# Altium project FMM-v1.0.PrjPcb (part 1 of 6)
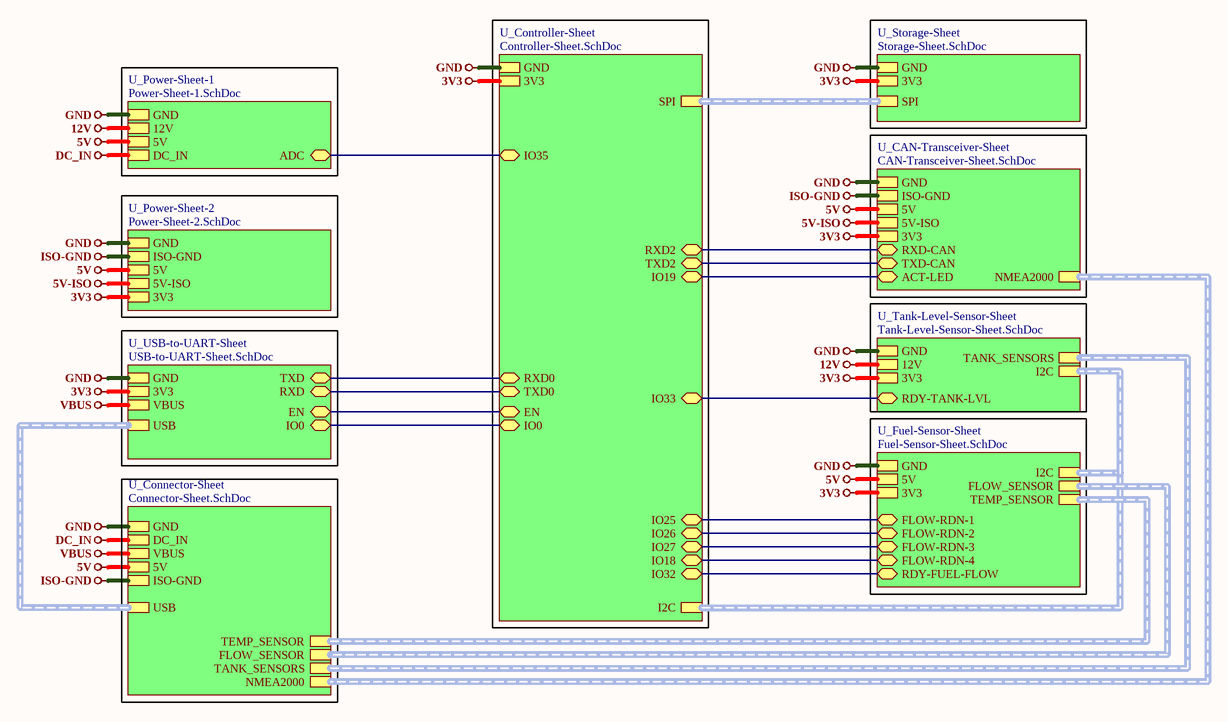
[diagram p0: Top-Sheet.SchDoc]
10 sheets, 218 parts. Net scope: hierarchical (ports join the sheet entries above them; power ports are global).
Board file: FMM-v1.0.PcbDoc
Sheets:
  Top-Sheet.SchDoc
    U_Power-Sheet-1 = Power-Sheet-1.SchDoc
    U_Power-Sheet-2 = Power-Sheet-2.SchDoc
    U_USB-to-UART-Sheet = USB-to-UART-Sheet.SchDoc
    U_Controller-Sheet = Controller-Sheet.SchDoc
    U_Storage-Sheet = Storage-Sheet.SchDoc
    U_CAN-Transceiver-Sheet = CAN-Transceiver-Sheet.SchDoc
    U_Tank-Level-Sensor-Sheet = Tank-Level-Sensor-Sheet.SchDoc
    U_Fuel-Sensor-Sheet = Fuel-Sensor-Sheet.SchDoc
    U_Connector-Sheet = Connector-Sheet.SchDoc

## Sheet Top-Sheet.SchDoc
size A4; SheetNumber: 1; SheetTotal: 10

### Sub-sheets
U_CAN-Transceiver-Sheet = CAN-Transceiver-Sheet.SchDoc: GND, 3V3, 5V-ISO, ISO-GND, RXD-CAN (bidir), TXD-CAN (bidir), ACT-LED (bidir), 5V, NMEA2000 (harness NMEA2000)
U_Connector-Sheet = Connector-Sheet.SchDoc: GND, DC_IN, VBUS, USB (harness USB), NMEA2000 (harness NMEA2000), ISO-GND, TANK_SENSORS (harness TANK_SENSORS), TEMP_SENSOR (harness TEMP_SENSOR), FLOW_SENSOR (harness FLOW_SENSOR), 5V
U_Controller-Sheet = Controller-Sheet.SchDoc: I2C (harness I2C), GND, 3V3, SPI (harness SPI), TXD0 (bidir), RXD0 (bidir), EN (bidir), IO0 (bidir), TXD2 (bidir), RXD2 (bidir), IO25 (bidir), IO26 (bidir), IO27 (bidir), IO18 (bidir), IO19 (bidir), IO35 (bidir), IO32 (bidir), IO33 (bidir)
U_Fuel-Sensor-Sheet = Fuel-Sensor-Sheet.SchDoc: I2C (harness I2C), 5V, GND, 3V3, FLOW-RDN-1 (bidir), FLOW-RDN-2 (bidir), FLOW-RDN-3 (bidir), FLOW-RDN-4 (bidir), RDY-FUEL-FLOW (bidir), TEMP_SENSOR (harness TEMP_SENSOR), FLOW_SENSOR (harness FLOW_SENSOR)
U_Power-Sheet-1 = Power-Sheet-1.SchDoc: 5V, GND, 12V, ADC (bidir), DC_IN
U_Power-Sheet-2 = Power-Sheet-2.SchDoc: 5V, GND, 3V3, 5V-ISO, ISO-GND
U_Storage-Sheet = Storage-Sheet.SchDoc: SPI (harness SPI), GND, 3V3
U_Tank-Level-Sensor-Sheet = Tank-Level-Sensor-Sheet.SchDoc: GND, 3V3, 12V, I2C (harness I2C), RDY-TANK-LVL (bidir), TANK_SENSORS (harness TANK_SENSORS)
U_USB-to-UART-Sheet = USB-to-UART-Sheet.SchDoc: GND, 3V3, TXD (bidir), RXD (bidir), EN (bidir), IO0 (bidir), VBUS, USB (harness USB)

### Nets
3V3: sheet U_Power-Sheet-2/3V3, sheet U_USB-to-UART-Sheet/3V3, sheet U_Controller-Sheet/3V3, sheet U_Storage-Sheet/3V3, sheet U_CAN-Transceiver-Sheet/3V3, sheet U_Tank-Level-Sensor-Sheet/3V3, sheet U_Fuel-Sensor-Sheet/3V3
5V: sheet U_Power-Sheet-1/5V, sheet U_Power-Sheet-2/5V, sheet U_CAN-Transceiver-Sheet/5V, sheet U_Fuel-Sensor-Sheet/5V, sheet U_Connector-Sheet/5V
5V-ISO: sheet U_Power-Sheet-2/5V-ISO, sheet U_CAN-Transceiver-Sheet/5V-ISO
12V: sheet U_Power-Sheet-1/12V, sheet U_Tank-Level-Sensor-Sheet/12V
DC_IN: sheet U_Power-Sheet-1/DC_IN, sheet U_Connector-Sheet/DC_IN
GND: sheet U_Power-Sheet-1/GND, sheet U_Power-Sheet-2/GND, sheet U_USB-to-UART-Sheet/GND, sheet U_Controller-Sheet/GND, sheet U_Storage-Sheet/GND, sheet U_CAN-Transceiver-Sheet/GND, sheet U_Tank-Level-Sensor-Sheet/GND, sheet U_Fuel-Sensor-Sheet/GND, sheet U_Connector-Sheet/GND
ISO-GND: sheet U_Power-Sheet-2/ISO-GND, sheet U_CAN-Transceiver-Sheet/ISO-GND, sheet U_Connector-Sheet/ISO-GND
VBUS: sheet U_USB-to-UART-Sheet/VBUS, sheet U_Connector-Sheet/VBUS
ACT-LED: sheet U_Controller-Sheet/IO19, sheet U_CAN-Transceiver-Sheet/ACT-LED
ADC: sheet U_Power-Sheet-1/ADC, sheet U_Controller-Sheet/IO35
EN: sheet U_USB-to-UART-Sheet/EN, sheet U_Controller-Sheet/EN
FLOW-RDN-1: sheet U_Controller-Sheet/IO25, sheet U_Fuel-Sensor-Sheet/FLOW-RDN-1
FLOW-RDN-2: sheet U_Controller-Sheet/IO26, sheet U_Fuel-Sensor-Sheet/FLOW-RDN-2
FLOW-RDN-3: sheet U_Controller-Sheet/IO27, sheet U_Fuel-Sensor-Sheet/FLOW-RDN-3
FLOW-RDN-4: sheet U_Controller-Sheet/IO18, sheet U_Fuel-Sensor-Sheet/FLOW-RDN-4
IO0: sheet U_USB-to-UART-Sheet/IO0, sheet U_Controller-Sheet/IO0
IO32: sheet U_Controller-Sheet/IO32, sheet U_Fuel-Sensor-Sheet/RDY-FUEL-FLOW
IO33: sheet U_Controller-Sheet/IO33, sheet U_Tank-Level-Sensor-Sheet/RDY-TANK-LVL
RXD: sheet U_USB-to-UART-Sheet/RXD, sheet U_Controller-Sheet/TXD0
RXD0: sheet U_USB-to-UART-Sheet/TXD, sheet U_Controller-Sheet/RXD0
RXD-CAN: sheet U_Controller-Sheet/RXD2, sheet U_CAN-Transceiver-Sheet/RXD-CAN
TXD-CAN: sheet U_Controller-Sheet/TXD2, sheet U_CAN-Transceiver-Sheet/TXD-CAN

### Buses and harness runs
harness sheet U_CAN-Transceiver-Sheet/NMEA2000 = sheet U_Connector-Sheet/NMEA2000
harness sheet U_Connector-Sheet/FLOW_SENSOR = sheet U_Fuel-Sensor-Sheet/FLOW_SENSOR
harness sheet U_Connector-Sheet/TANK_SENSORS = sheet U_Tank-Level-Sensor-Sheet/TANK_SENSORS
harness sheet U_Connector-Sheet/TEMP_SENSOR = sheet U_Fuel-Sensor-Sheet/TEMP_SENSOR
harness sheet U_Connector-Sheet/USB = sheet U_USB-to-UART-Sheet/USB
harness sheet U_Controller-Sheet/I2C = sheet U_Fuel-Sensor-Sheet/I2C = sheet U_Tank-Level-Sensor-Sheet/I2C
harness sheet U_Controller-Sheet/SPI = sheet U_Storage-Sheet/SPI

### Notes on the sheet
- File:
- Title:
- Date:
- Page
- Num:
- Total:
- Drawn By: Huzaifa Ali

## Sheet Power-Sheet-1.SchDoc
size A4; SheetNumber: 2; SheetTotal: 10
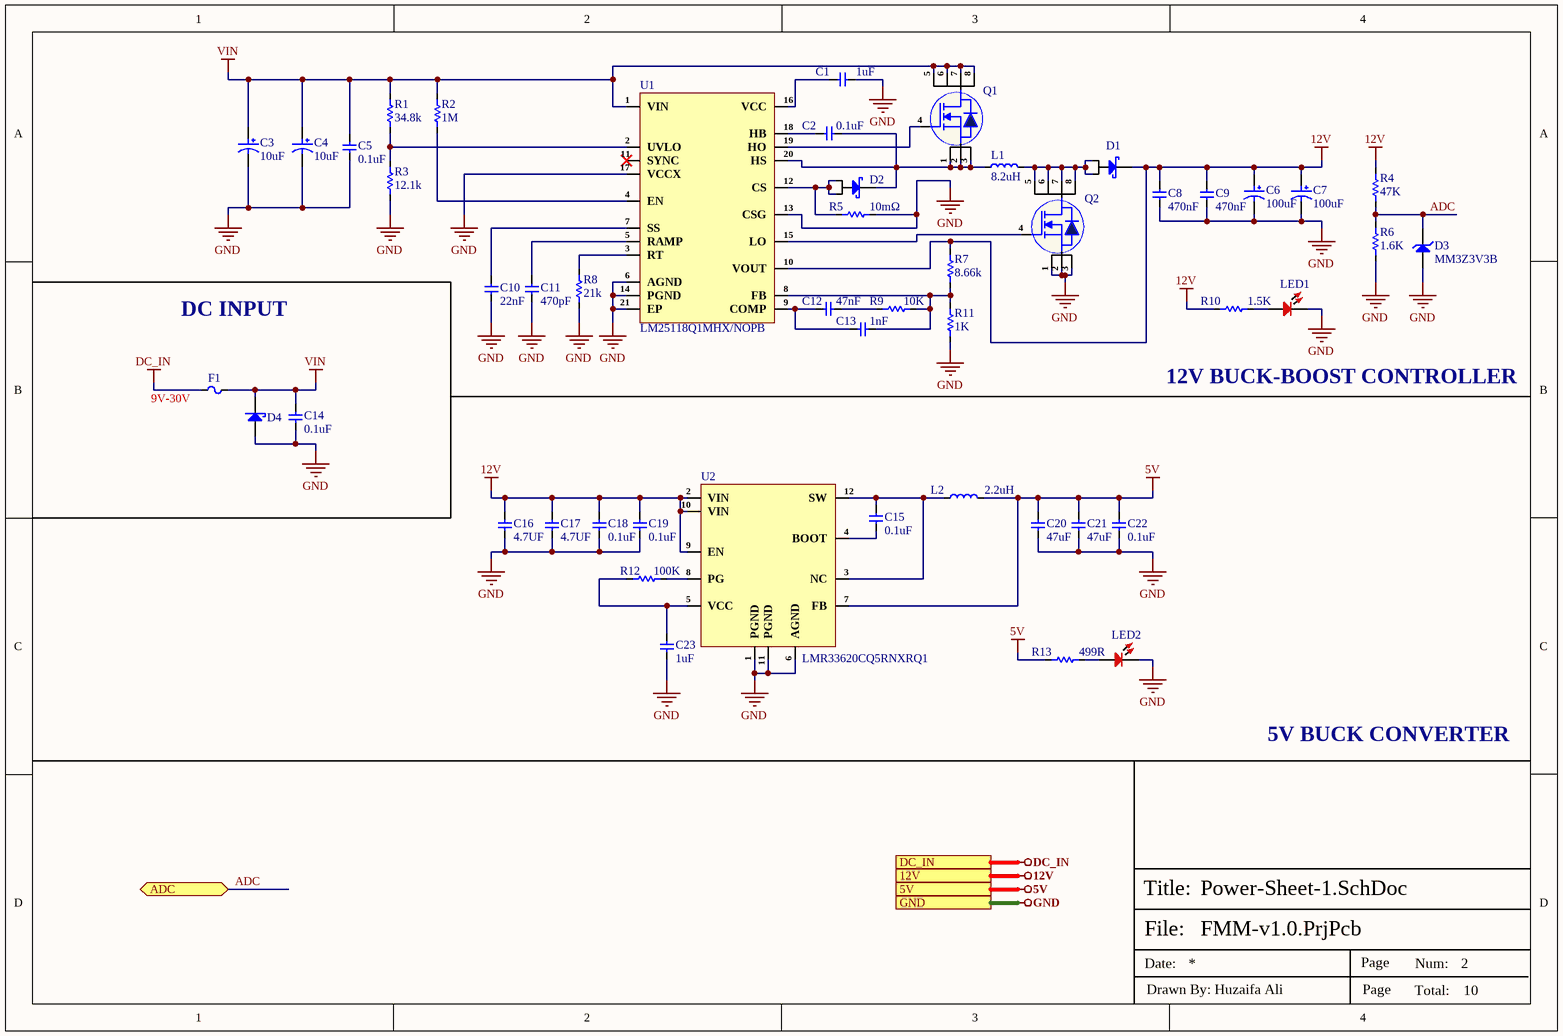
[diagram p1: Power-Sheet-1.SchDoc]

### Parts
C1  1uF  [Cap-0402]
C2  0.1uF  [Cap-0402]
C3  10uF  [50SVPF10M]
C4  10uF  [50SVPF10M]
C5  0.1uF  [Cap-0402]
C6  100uF  [25SVPF100M]
C7  100uF  [25SVPF100M]
C8  470nF  [Cap-0603]
C9  470nF  [Cap-0603]
C10  22nF  [Cap-0402]
C11  470pF  [Cap-0402]
C12  47nF  [Cap-0402]
C13  1nF  [Cap-0402]
C14  0.1uF  [Cap-0402]
C15  0.1uF  [Cap-0402]
C16  4.7UF  [Cap-0603]
C17  4.7UF  [Cap-0603]
C18  0.1uF  [Cap-0402]
C19  0.1uF  [Cap-0402]
C20  47uF  [Cap-1206]
C21  47uF  [Cap-1206]
C22  0.1uF  [Cap-0402]
C23  1uF  [Cap-0402]
D1  STPS20M100SG-TR  [D2Pak.]  (value not drawn)
D2  PDS760-13  [Power-DI-5]  (value not drawn)
D3  MM3Z3V3B  [SOD323F]
D4  3.0SMCJ30AQ-13  [SMC]  (value not drawn)
F1  BSMD1206-100-16V  [Fuse 1206 (3216 Metric)]  (value not drawn)
L1  8.2uH  [SRP1265A-8R2M]
L2  2.2uH  [CLF7045T-2R2N-D]
LED1  RED  [LED-0603]  (value not drawn)
LED2  RED  [LED-0603]  (value not drawn)
Q1  CSD18504Q5A  [8-VSONP (5x6)]  (value not drawn)
Q2  CSD17309Q3  [8-VSON-CLIP (3.3x3.3)]  (value not drawn)
R1  34.8k  [Res-0402]
R2  1M  [Res-0402]
R3  12.1k  [Res-0402]
R4  47K  [Res-0603]
R5  10mΩ  [RES-2512]
R6  1.6K  [Res-0402]
R7  8.66k  [Res-0402]
R8  21k  [Res-0402]
R9  10K  [Res-0402]
R10  1.5K  [Res-0402]
R11  1K  [Res-0402]
R12  100K  [Res-0402]
R13  499R  [Res-0402]
U1  LM25118Q1MHX/NOPB  [20-HTSSOP]
U2  LMR33620CQ5RNXRQ1  [12-VQFN-HR (3x2)]

### Ports
5V (see Top-Sheet[1A], CAN-Transceiver-Sheet[3D], Connector-Sheet[3D], Fuel-Sensor-Sheet[4C], Power-Sheet-2[3D]), 12V (see Top-Sheet[1A], Tank-Level-Sensor-Sheet[3D]), ADC (bidir, see Top-Sheet[2A]), DC_IN (see Top-Sheet[1A], Connector-Sheet[3D]), GND (see Top-Sheet[1A], CAN-Transceiver-Sheet[3D], Connector-Sheet[3D], Controller-Sheet[3D], Fuel-Sensor-Sheet[4C], Power-Sheet-2[3D], Storage-Sheet[3D], Tank-Level-Sensor-Sheet[3D], USB-to-UART-Sheet[3D])

### Nets
5V: C20.2 C21.2 C22.2 L2.2 R13.1 U2.7(FB) ; port 5V
12V: C6.1 C7.1 C8.2 C9.2 C16.2 C17.2 C18.2 C19.2 D1.3(K) R4.2 R7.2 R10.1 U1.10(VOUT) U2.2(VIN) U2.9(EN) U2.10(VIN) ; port 12V
DC_IN: F1.1 ; port DC_IN
GND: C1.1 C3.2 C4.2 C5.1 C6.2 C7.2 C8.1 C9.1 C10.1 C11.1 C14.1 C16.1 C17.1 C18.1 C19.1 C20.1 C21.1 C22.1 C23.1 D3.1(A) D4.2(A) LED1.2 LED2.2 Q2.1(S) Q2.2(S) Q2.3(S) R3.1 R5.2 R6.1 R8.1 R11.1 U1.6(AGND) U1.13(CSG) U1.14(PGND) U1.17(VCCX) U1.21(EP) U2.1(PGND) U2.6(AGND) U2.11(PGND) ; port GND
VIN: C3.1 C4.1 C5.2 C14.2 D4.1(K) F1.2 Q1.5(D) Q1.6(D) Q1.7(D) Q1.8(D) R1.2 R2.2 U1.1(VIN)
ADC: D3.2(K) R4.1 R6.2 ; port ADC
NetC1_2: C1.2 U1.16(VCC)
NetC2_1: C2.1 D2.3(K) L1.1 Q1.1(S) Q1.2(S) Q1.3(S) U1.20(HS)
NetC2_2: C2.2 U1.18(HB)
NetC10_2: C10.2 U1.7(SS)
NetC11_2: C11.2 U1.5(RAMP)
NetC12_1: C12.1 C13.2 U1.9(COMP)
NetC12_2: C12.2 R9.1
NetC13_1: C13.1 R7.1 R9.2 R11.2 U1.8(FB)
NetC15_1: C15.1 U2.4(BOOT)
NetC15_2: C15.2 L2.1 U2.3(NC) U2.12(SW)
NetC23_2: C23.2 R12.1 U2.5(VCC)
NetD1_1: D1.1(A) D1.2(A) L1.2 Q2.5(D) Q2.6(D) Q2.7(D) Q2.8(D)
NetD2_1: D2.1(A) D2.2(A) R5.1 U1.12(CS)
NetLED1_1: LED1.1 R10.2
NetLED2_1: LED2.1 R13.2
NetQ1_4: Q1.4(G) U1.19(HO)
NetQ2_4: Q2.4(G) U1.15(LO)
NetR1_1: R1.1 R3.2 U1.2(UVLO)
NetR2_1: R2.1 U1.4(EN)
NetR8_2: R8.2 U1.3(RT)
NetR12_2: R12.2 U2.8(PG)

Not connected (* = marked no-connect by the designer): U1 11(SYNC)*

### Notes on the sheet
- DC INPUT
- 12V BUCK-BOOST CONTROLLER
- (near F1) 9V-30V
- 5V BUCK CONVERTER
- File:
- Title:
- Date:
- Page
- Num:
- Total:
- Drawn By: Huzaifa Ali